# Altium schematic sheet [6] USB.SchDoc
size B; Organization: Altium Limited; Address1: L3, 12a Rodborough Rd; Address2: Frenchs Forest; Address3: NSW; Address4: Australia 2086
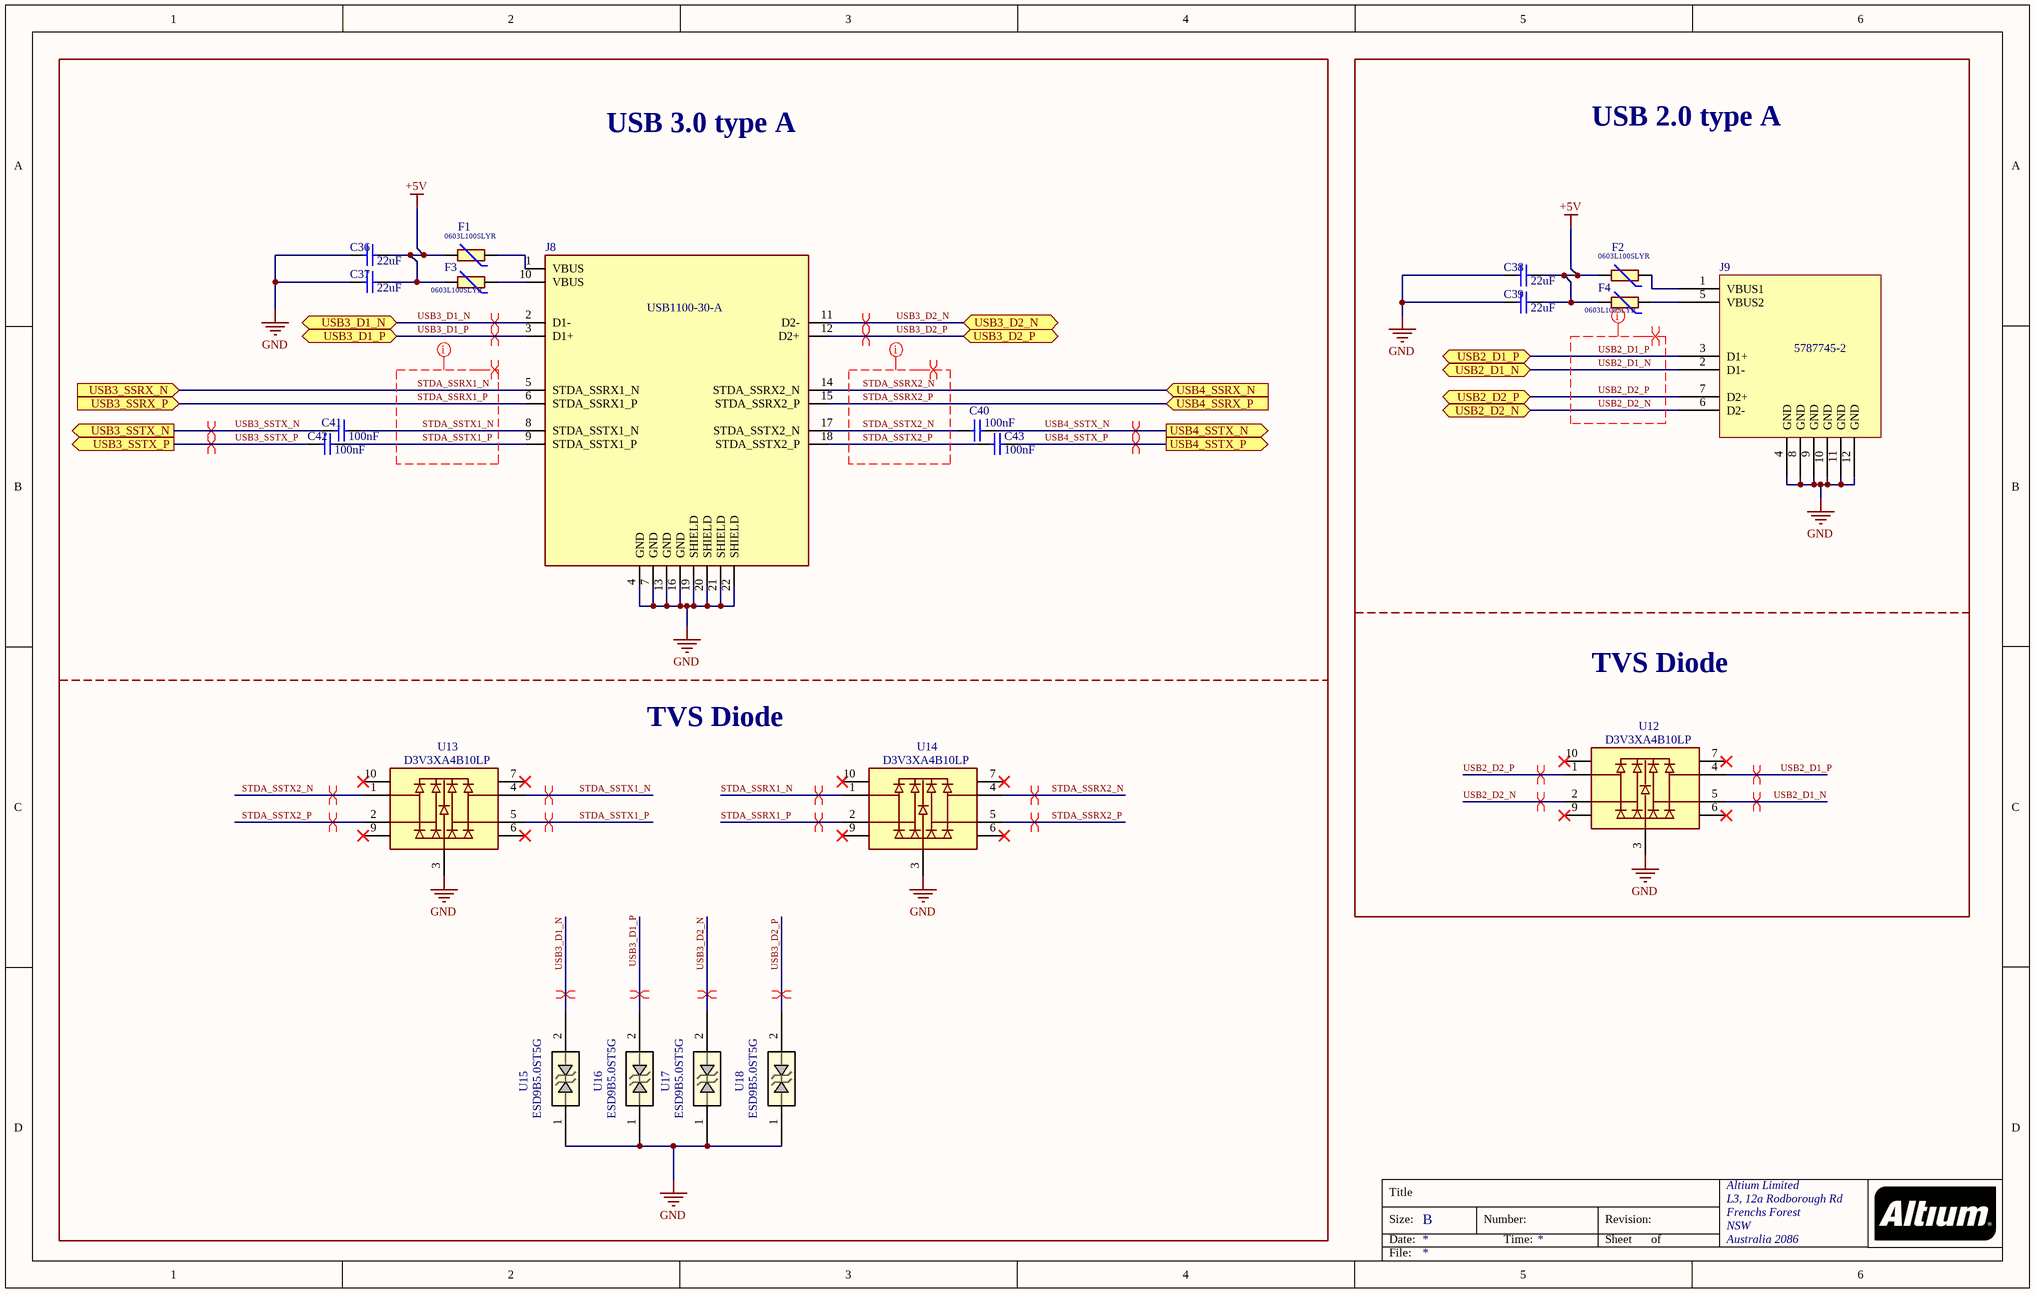
[diagram p0: [6] USB.SchDoc]

## Parts
C36  22uF  [Capacitor 0402]
C37  22uF  [Capacitor 0402]
C38  22uF  [Capacitor 0402]
C39  22uF  [Capacitor 0402]
C40  100nF  [Capacitor 0402]
C41  100nF  [Capacitor 0402]
C42  100nF  [Capacitor 0402]
C43  100nF  [Capacitor 0402]
F1  0603L100SLYR  [FUSC1608X100N]
F2  0603L100SLYR  [FUSC1608X100N]
F3  0603L100SLYR  [FUSC1608X100N]
F4  0603L100SLYR  [FUSC1608X100N]
J8  USB1100-30-A  [CONN_USB1100_GCT]
J9  5787745-2  [CONN_5787745-2_TEC]
U12  D3V3XA4B10LP  [ESDLC0524DFN10TP]
U13  D3V3XA4B10LP  [ESDLC0524DFN10TP]
U14  D3V3XA4B10LP  [ESDLC0524DFN10TP]
U15  ESD9B5.0ST5G  [SOD-923_ONS]
U16  ESD9B5.0ST5G  [SOD-923_ONS]
U17  ESD9B5.0ST5G  [SOD-923_ONS]
U18  ESD9B5.0ST5G  [SOD-923_ONS]

## Ports
USB2_D1_N (bidir), USB2_D1_P (bidir), USB2_D2_N (bidir), USB2_D2_P (bidir), USB3_D1_N (bidir), USB3_D1_P (bidir), USB3_D2_N (bidir), USB3_D2_P (bidir), USB3_SSRX_N (in), USB3_SSRX_P (in), USB3_SSTX_N (out), USB3_SSTX_P (out), USB4_SSRX_N (in), USB4_SSRX_P (in), USB4_SSTX_N (out), USB4_SSTX_P (out)

## Nets
+5V: C36.2 C37.2 C38.2 C39.2 F1.2 F2.2 F3.2 F4.2
GND: C36.1 C37.1 C38.1 C39.1 J8.4(GND) J8.7(GND) J8.13(GND) J8.16(GND) J8.19(SHIELD) J8.20(SHIELD) J8.21(SHIELD) J8.22(SHIELD) J9.4(GND) J9.8(GND) J9.9(GND) J9.10(GND) J9.11(GND) J9.12(GND) U12.3(VSS) U13.3(VSS) U14.3(VSS) U15.1 U16.1 U17.1 U18.1
STDA_SSRX1_N: J8.5(STDA_SSRX1_N) U14.1(I/O) ; port USB3_SSRX_N
STDA_SSRX1_P: J8.6(STDA_SSRX1_P) U14.2(I/O) ; port USB3_SSRX_P
STDA_SSRX2_N: J8.14(STDA_SSRX2_N) U14.4(I/O) ; port USB4_SSRX_N
STDA_SSRX2_P: J8.15(STDA_SSRX2_P) U14.5(I/O) ; port USB4_SSRX_P
STDA_SSTX1_N: C41.1 J8.8(STDA_SSTX1_N) U13.4(I/O)
STDA_SSTX1_P: C42.1 J8.9(STDA_SSTX1_P) U13.5(I/O)
STDA_SSTX2_N: C40.1 J8.17(STDA_SSTX2_N) U13.1(I/O)
STDA_SSTX2_P: C43.1 J8.18(STDA_SSTX2_P) U13.2(I/O)
USB2_D1_N: J9.2(D1-) U12.5(I/O) ; port USB2_D1_N
USB2_D1_P: J9.3(D1+) U12.4(I/O) ; port USB2_D1_P
USB2_D2_N: J9.6(D2-) U12.2(I/O) ; port USB2_D2_N
USB2_D2_P: J9.7(D2+) U12.1(I/O) ; port USB2_D2_P
USB3_D1_N: J8.2(D1-) U15.2 ; port USB3_D1_N
USB3_D1_P: J8.3(D1+) U16.2 ; port USB3_D1_P
USB3_D2_N: J8.11(D2-) U17.2 ; port USB3_D2_N
USB3_D2_P: J8.12(D2+) U18.2 ; port USB3_D2_P
USB3_SSTX_N: C41.2 ; port USB3_SSTX_N
USB3_SSTX_P: C42.2 ; port USB3_SSTX_P
USB4_SSTX_N: C40.2 ; port USB4_SSTX_N
USB4_SSTX_P: C43.2 ; port USB4_SSTX_P
NetF1_1: F1.1 J8.1(VBUS)
NetF2_1: F2.1 J9.1(VBUS1)
NetF3_1: F3.1 J8.10(VBUS)
NetF4_1: F4.1 J9.5(VBUS2)

Not connected (* = marked no-connect by the designer): U12 6(NC)* 7(NC)* 9(NC)* 10(NC)*; U13 6(NC)* 7(NC)* 9(NC)* 10(NC)*; U14 6(NC)* 7(NC)* 9(NC)* 10(NC)*

## Layout directives
mark named USB 3.0: STDA_SSRX1_N, STDA_SSRX1_P, STDA_SSRX2_N, STDA_SSRX2_P, STDA_SSTX1_N, STDA_SSTX1_P, STDA_SSTX2_N, STDA_SSTX2_P
differential pair; differential pair class 90_OHM_DIFF: STDA_SSRX1_N, STDA_SSRX1_P, STDA_SSRX2_N, STDA_SSRX2_P, STDA_SSTX1_N, STDA_SSTX1_P, STDA_SSTX2_N, STDA_SSTX2_P, USB2_D1_N, USB2_D1_P, USB2_D2_N, USB2_D2_P, USB3_D1_N, USB3_D1_P, USB3_D2_N, USB3_D2_P, USB3_SSTX_N, USB3_SSTX_P, USB4_SSTX_N, USB4_SSTX_P
mark named USB 2.0: USB2_D1_N, USB2_D1_P, USB2_D2_N, USB2_D2_P

## Notes on the sheet
- USB 3.0 type A
- USB 2.0 type A
- TVS Diode
- Title
- Size:
- Date:
- B
- Number:
- Time:
- Revision:
- Sheet
- of
- File:

## Library data of the parts
C36-C43 = Capacitor 0402: Capacitor Ceramico SMD 0402
F1-F4 = 0603L100SLYR: Fuse, Resettable, 603L Series, Polymeric, Surface Mount, 6V, 1A | Littelfuse 0603L100SLYR; SnapEDA_Link: https://www.snapeda.com/parts/0603L100SLYR/Littelfuse/view-part/?ref=snap; Package: Package; Value: *; MF: Littelfuse; MP: 0603L100SLYR; Check_prices: https://www.snapeda.com/parts/0603L100SLYR/Littelfuse/view-part/?ref=eda
J8 = USB1100-30-A: Description; Manufacturer_Name: Global Connector Technology; Copyright: Copyright (C) 2026 Ultra Librarian. All rights reserved.; Manufacturer_Part_Number: USB1100-30-A; RefDes: RefDes; Type: Type
J9 = 5787745-2: USB A R/A STAK ASSY THRU HOLE; Manufacturer_Name: TE Connectivity; Copyright: Copyright (C) 2026 Ultra Librarian. All rights reserved.; Manufacturer_Part_Number: 5787745-2; RefDes: RefDes; Type: Type
U12-U14 = D3V3XA4B10LP: 9.4V (típico) Abrazadera 4 A (8/20µs) Ipp TVS - Diodos Montaje en superficie U-DFN2510-10
U15-U18 = ESD9B5.0ST5G: Description; Manufacturer_Name: onsemi; Copyright: Copyright (C) 2025 Ultra Librarian. All rights reserved.; Manufacturer_Part_Number: ESD9B5.0ST5G; RefDes: RefDes; Type: Type